# Altium schematic sheet DRV8876.SchDoc: FOC_driver
size A4; Author: Alesky Alcarraz Jaime; Revision: 1.0; SheetNumber: 5; SheetTotal: 5
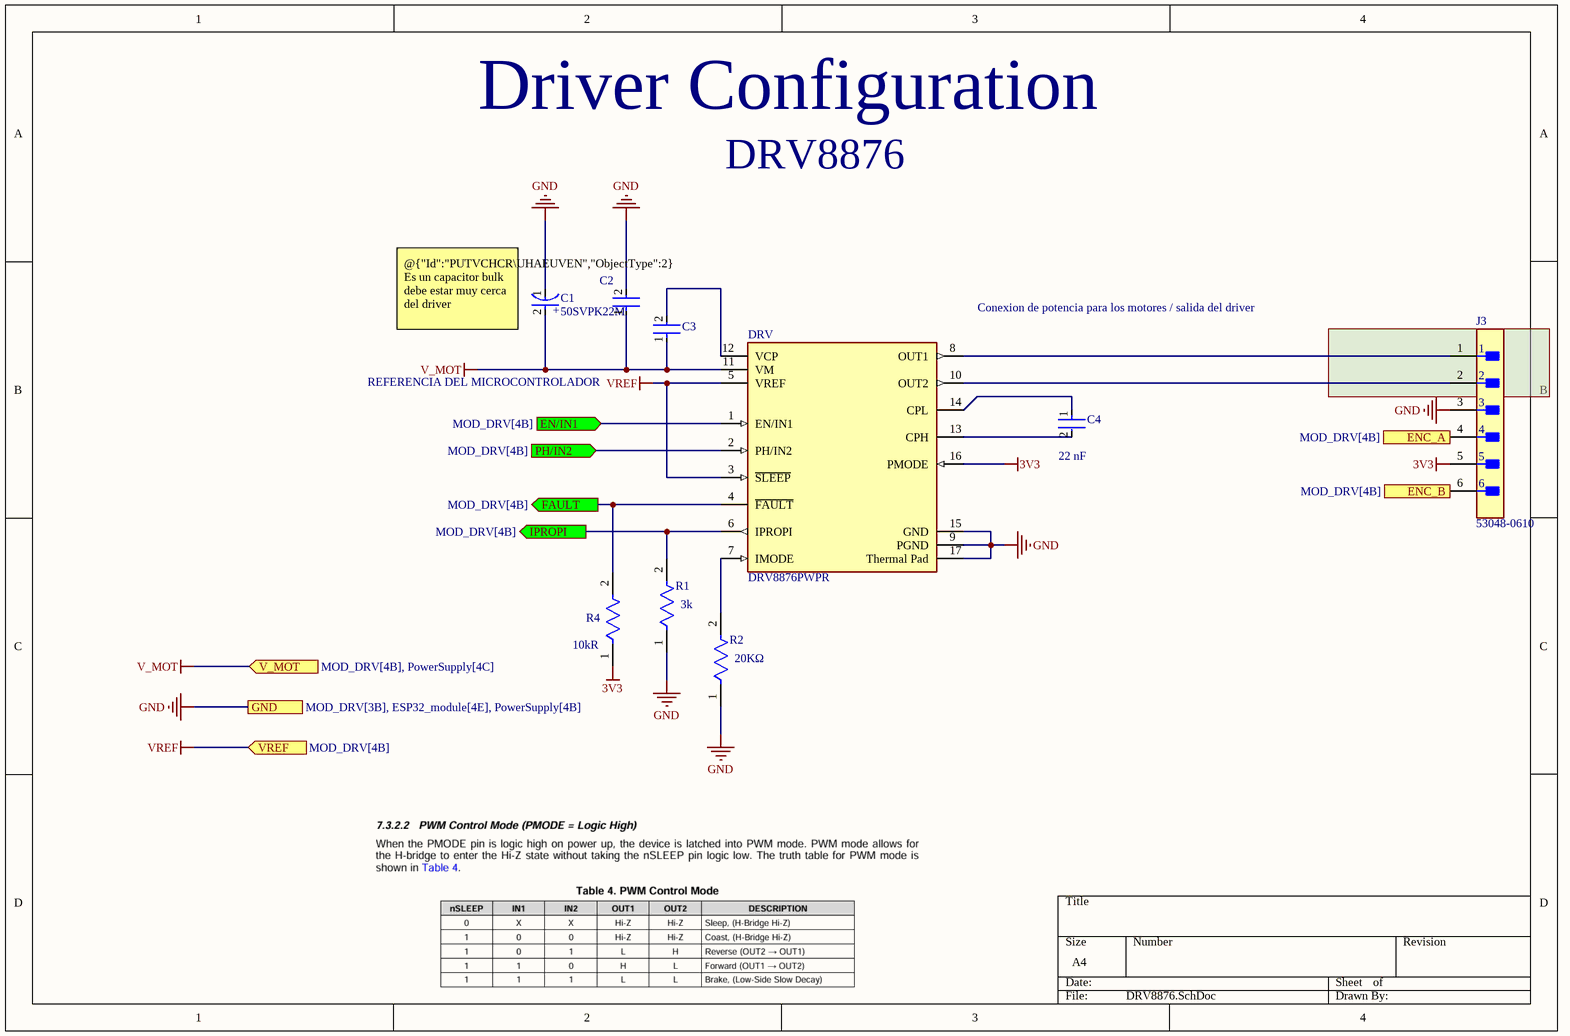
[diagram p0: DRV8876.SchDoc]

## Parts
C1  50SVPK22M  [FP-OS-CON-SMT-C6-MFG]
C2  TMK316SD104KL-T  [FP-1206-L_3_2_0_15-W_1_6-IPC_C]  (value not drawn)
C3  CC0402MRX5R7BB104  [FP-CC0402-IPC_C]  (value not drawn)
C4  value 22 nF  [FP-CC0402-MFG]  (hidden comment: CC0402KRX5R8BB223)
DRV  DRV8876PWPR  [FP-PWP0016C-IPC_C]
J3  53048-0610  [FP-53048-0610-MFG]
R1  Parameter 1: 3k  [FP-RN73R1J-IPC_A]  (hidden comment: RN73R1JTTD3001F50)
R2  value 20KΩ  [FP-RT0603-MFG]  (hidden comment: RT0603DRD0720KL)
R4  Resistance: 10kR  [FP-RK73H1J-IPC_C]  (hidden comment: RK73H1JLTDD1002F)

## Ports
EN/IN1 (in, see MOD_DRV[4B]), ENC_A (out, see MOD_DRV[4B]), ENC_B (out, see MOD_DRV[4B]), FAULT (out, see MOD_DRV[4B]), GND (see MOD_DRV[3B], ESP32_module[4E], PowerSupply[4B]), IPROPI (out, see MOD_DRV[4B]), PH/IN2 (in, see MOD_DRV[4B]), V_MOT (in, see MOD_DRV[4B], PowerSupply[4C]), VREF (in, see MOD_DRV[4B])

## Nets
3V3: DRV.16(PMODE) J3.5 R4.1
GND: C1.1(C) C2.2 DRV.9(PGND) DRV.15(GND) DRV.17(Thermal_Pad) J3.3 R1.1 R2.1 ; port GND
V_MOT: C1.2(A) C2.1 C3.1 DRV.11(VM) ; port V_MOT
VREF: DRV.3(~{SLEEP}) DRV.5(VREF) ; port VREF
EN/IN1: DRV.1(EN/IN1) ; port EN/IN1
ENC_A: J3.4 ; port ENC_A
ENC_B: J3.6 ; port ENC_B
FAULT: DRV.4(~{FAULT}) R4.2 ; port FAULT
IPROPI: DRV.6(IPROPI) R1.2 ; port IPROPI
PH/IN2: DRV.2(PH/IN2) ; port PH/IN2
NetC3_2: C3.2 DRV.12(VCP)
NetC4_1: C4.1 DRV.14(CPL)
NetC4_2: C4.2 DRV.13(CPH)
NetDRV_7: DRV.7(IMODE) R2.2
NetDRV_8: DRV.8(OUT1) J3.1
NetDRV_10: DRV.10(OUT2) J3.2

## Notes on the sheet
- Driver Configuration
- DRV8876
- Conexion de potencia para los motores / salida del driver
- REFERENCIA DEL MICROCONTROLADOR
- (near C1) @{"Id":"PUTVCHCR\UHAEUVEN","ObjectType":2} Es un capacitor bulk debe estar muy cerca del driver
- (in symbol CMP-05428-000935-1) +

## Library data of the parts
C1 = CMP-05428-000935-1: Conductive Polymer Aluminum Solid Capacitors (OS-CON) 22uF ±20% 50V; ESR (Equivalent Series Resistance): 35mR; Life (Hours): 1000Hour; RoHS Compliant: Yes; Max Operating Temperature: 125°C; Min Operating Temperature: -55°C; Capacitance: 22uF; Case/Package: Radial; Packaging: Cut Tape; Voltage Rating: 50V; Mount: Surface Mount; Series: OS-CON™, SVPK; Tolerance: 20%
C2 = CMP-14477-003553-3: Ceramic Capacitor, 1206, 0.1uF, 10%, 25V; NexarPartId: 198412; Capacitance: 100nF; Packaging: Cut Tape; Termination: SMD/SMT; Voltage Rating: 25V; REACH SVHC: Unknown; Case/Package: 1206; Material: Ceramic; Max Width: 1.75mm; Case Code (Imperial): 1206; RoHS: Compliant; Max Thickness: 1.8mm; Min Thickness: 1.4mm; Max Length: 3.35mm; Min Length: 3.05mm; Lead Free: Lead Free; Thickness: 1.8034mm; Number of Pins: 2; Mount: Surface Mount; Dielectric Material: Ceramic; Height: 1.8mm; Composition: Ceramic; Width: 1.6mm; Min Width: 1.45mm; Halogen Free: Halogen Free; Tolerance: 10%; Voltage Rating (DC): 25V; Min Operating Temperature: -55°C; Max Operating Temperature: 125°C; Case Code (Metric): 3216; Depth: 1.6mm; Length: 3.2mm; Voltage: 25V
C3 = CMP-03422-001312-1: CAP CER 0.1UF 16V X5R 0402; Manufacturer: YAGEO; Value: 100 nF; Automotive Grade: NA; Material: Ceramic; Tolerance: 0.2; Temperature Coefficient: 30ppm/°C; Temperature: -55°C to +125°C; Footprint Url: http://www.yageo.com/exep/pages/download/literatures/UPY-C_GEN_24.pdf; Height: 0.55mm; Ipc Land Pattern Name: CAPC10050X50; Digikey Description: CAP CER 0.1UF 16V X5R 0402; Device Class L2: Capacitors; Mouser Description: Multilayer Ceramic Capacitors MLCC - SMD/SMT 100nF 16V X5R 20%; Octopart: https://octopart.com/cc0402mrx5r7bb104-yageo-33242280; ComponentLink2Description: Datasheet; Temperature Range Low: -55°C; Manufacturer Part Number: CC0402MRX5R7BB104; RoHS: TRUE; Device Class L3: Ceramic Capacitors; Automotive: No; Temperature Characteristic: X5R; Temperature Range High: +125°C; Device Class L1: Passive Components; Package: CC0402; Lead Free: Yes; Voltage Rating: 16 V; Category: Cap; Capacitance: 100 nF; ComponentLink2URL: http://www.yageo.com/documents/recent/UPY-GP_NP0_16V-to-50V_16.pdf
C4 = CMP-03422-000870-1: CC0402 22 nF X5R 10.00% 25 V; Manufacturer: YAGEO; Temperature Coefficient: 30ppm/°C; Material: Ceramic; Tolerance: 0.1; Voltage Rating: 25 V; Automotive Grade: NA; Automotive: No; Temperature Range Low: -55°C; ComponentLink2Description: Datasheet; Ipc Land Pattern Name: CAPC10050X50; Device Class L2: Capacitors; Device Class L3: Ceramic Capacitors; Capacitance: 22 nF; Lead Free: Yes; ComponentLink2URL: http://www.yageo.com/documents/recent/UPY-GP_NP0_16V-to-50V_16.pdf; RoHS: TRUE; Height: 0.55mm; Package: CC0402; Device Class L1: Passive Components; Category: Cap; Temperature: -55°C to +125°C; Manufacturer Part Number: CC0402KRX5R8BB223; Temperature Range High: +125°C; Octopart: https://octopart.com/cc0402krx5r8bb223-yageo-88496716; Footprint Url: http://www.yageo.com/exep/pages/download/literatures/UPY-C_GEN_24.pdf; Temperature Characteristic: X5R
DRV = CMP-04915-000007-1: PWR MGMT MOTOR/FAN DRIVER
J3 = CMP-2000-05632-2: CONN HEADER R/A 6POS 1.25MM; Number of Positions: 6; Glow Wire Compliant: Non-compliant; Max Voltage Rating (AC): 250V; Contact Resistance: 20mR; Voltage Rating: 125V; Current Rating: 1A; Insulation Resistance: 100MR; Max Current Rating: 3A; Gender: Male; RoHS Compliant: Yes; Color: Natural; Pitch: 1.25mm; Termination: Solder; Orientation: Right Angle; Max Operating Temperature: 85°C; Contact Plating: Tin; Series: PicoBlade; Housing Material: Nylon; Number of Rows: 1; Height: 6.99mm; Mount: Through Hole; Flammability Rating: UL94 V-0; Voltage Rating (DC): 125V; Number of Contacts: 6; Contact Material: Bronze; Lead Free: Lead Free; Depth: 5.5mm; Number of Circuits: 6; Contact Type: Blade Pin; Package Quantity: 2000; Packaging: Tray; Min Operating Temperature: -40°C; Radiation Hardening: No; Housing Color: Natural
R1 = CMP-04015-029754-1: 3kΩ ±1% 0.1W, 1/10W Chip Resistor 0603 (1608 Metric) Moisture Resistant Thin Film / RN73R1JTTD3001F50
R2 = CMP-2000-04568-2: RES SMD 20K OHM 0.5% 1/10W 0603 / RT0603DRD0720KL; Manufacturer: Yageo; Power Rating: 0.1W; Temperature Coefficient: 25 ppm/°C; Voltage Rating: 75V; Tolerance: 0.005; Ipc Land Pattern Name: RESC16080X45; Footprint Url: http://www.yageo.com/exep/pages/download/literatures/PYu-R_Mount_10.pdf; Lead Free: Yes; Height: 0.55mm; Temperature Range High: +155°C; Manufacturer Part Number: RT0603DRD0720KL; Package: RT0603; Temperature: -55°C to +155°C; RoHS: TRUE; Composition: Thin Film; Category: Res; Digikey Description: RES SMD 20K OHM 0.5% 1/10W 0603; Series: RT; Automotive: No; Device Class L1: Passive Components; Device Class L2: Resistors; ComponentLink2Description: Datasheet; Resistance: 20KΩ; Device Class L3: Chip SMD Resistors; Temperature Range Low: -55°C; Octopart: https://octopart.com/rt0603drd0720kl-yageo-1224030; ComponentLink2URL: http://www.yageo.com/documents/recent/PYu-RT_1-to-0.01_RoHS_L_9.pdf
R4 = CMP-04015-089147-1: 10kΩ ±1% 0.1W Chip Resistor 0603 Thick Film AEC-Q200 Qualified / RK73H1JLTDD1002F; Power Rating: 100mW; Temperature Coefficient: 100ppm/°C; Voltage Rating: 50V; Military Standard: Not; Packaging: Tape and Reel; RoHS Compliant: No; Lead Free: Contains Lead; Max Operating Temperature: 155°C; Min Operating Temperature: -55°C; Construction: Rectangular; Depth: 0.8mm; Series: RK73H; Resistor Type: Thick Film; Case Code (Metric): 1608; Length: 1.6mm; Termination: SMD/SMT; Tolerance: 1%; Case/Package: 0603; Case Code (Imperial): 0603